# Altium schematic sheet 203_DC-DC.SchDoc: DC-DC
size A4; Date: XXXXXX; Author: R.Ducuara; DrawnBy: J.Jaramillo; Revision: R1V0; SheetNumber: 6; SheetTotal: 7
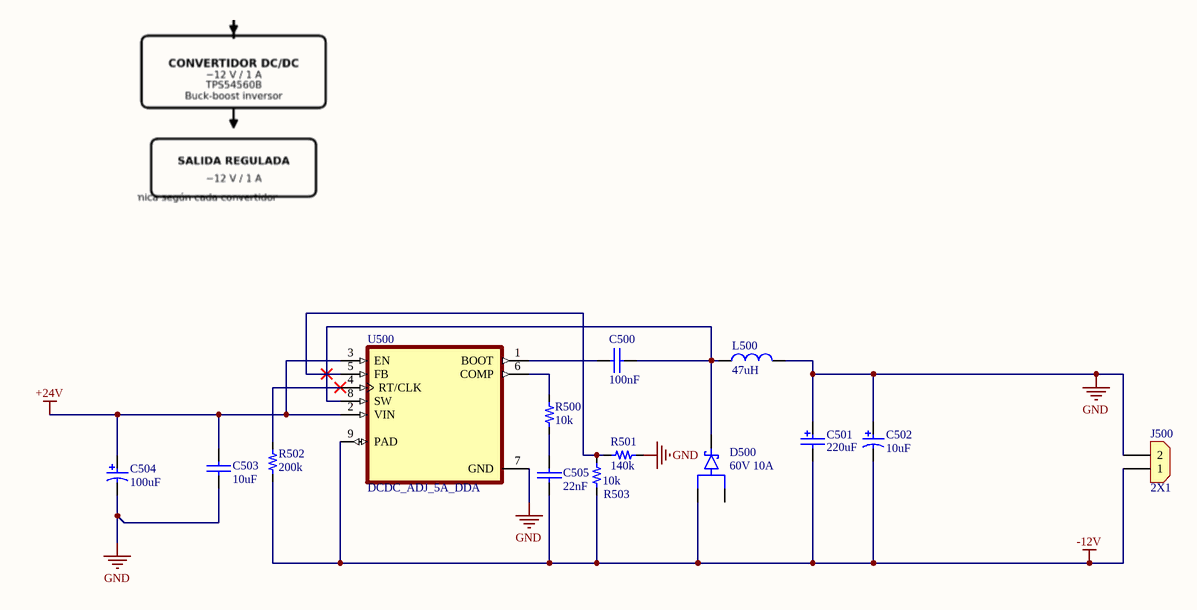
[diagram p0: 203_DC-DC.SchDoc]

## Parts
C500  value 100nF  [1206]  (hidden comment: 100nF 100V)
C501  value 220uF  [RADIAL-CAN-SMD_Diax8mm_Hx10.2mm]  (hidden comment: 220uF 35V)
C502  value 10uF  [RADIAL-CAN-SMD_Diax4mm_Hx5.5mm]  (hidden comment: 10uF 25V)
C503  value 10uF  [1206]  (hidden comment: 10uF 50V)
C504  value 100uF  [RADIAL-CAN-SMD_Diax8mm_Hx10.2mm]  (hidden comment: 100uF 25V)
C505  value 22nF  [0402_1.0mm]  (hidden comment: 22nF 25V)
D500  60V 10A  [D_Schottky_30V_200mA_SOT23-3_1]
J500  2X1  [CON_2X1_TH_5MM_BAT]
L500  value 47uH  [L_2SMD_11.5x10X4MM]  (hidden comment: 47uH 3A)
R500  value 10k  [0603]  (hidden comment: 10k 1/10W)
R501  value 140k  [0603]  (hidden comment: 140K 1/10W)
R502  value 200k  [1206]  (hidden comment: 200k 1/4W)
R503  value 10k  [0603]  (hidden comment: 10k 1/10W)
U500  DCDC_ADJ_5A_DDA  [DCDC_ADJ_5A_DDA]

## Nets
+24V: C503.1 C504.1 U500.2(VIN) U500.3(EN)
-12V: C501.2 C502.2 C505.2 D500.1(A1) J500.1 R502.1 R503.1 U500.9(PAD)
GND: C501.1 C502.1 C503.2 C504.2 J500.2 L500.2 R501.2 U500.7(GND)
NetC500_1: C500.1 U500.1(BOOT)
NetC500_2: C500.2 D500.3(K) L500.1 U500.8(SW)
NetC505_1: C505.1 R500.1
NetR500_2: R500.2 U500.6(COMP)
NetR501_1: R501.1 R503.2 U500.5(FB)
NetR502_2: R502.2 U500.4(RT/CLK)

Not connected (* = marked no-connect by the designer): D500 2(A2)

## Notes on the sheet
- Title:
- Project:
- File:
- Revision:
- Date:
- Size:
- A4
- Drawn by:

## Library data of the parts
C500 = Cap_0.1uF_1206_100V: CAP CER 0.1UF 100V X7R 1206; Manufacturer: Samsung Electro-Mechanics; Manufacturer Part Number: CL31B104KCFNNNE; Supplier 1: Digi-Key; Supplier Part Number 1: 1276-1151-1-ND; Last modified by: J.Jaramillo; Last modified date: 20240309; ComponentLink1Description: Digi-Key; ComponentLink1URL: https://www.digikey.com/en/products/detail/samsung-electro-mechanics/CL31B104KCFNNNE/3886809
C501 = Cap_220uF_35V_ALU_SMD_1: CAP ALUM 220UF 20% 35V SMD; Manufacturer: Panasonic Electronic Components; Manufacturer Part Number: EEE-1VA221UP; Supplier 1: Digi-Key; Supplier Part Number 1: PCE3955CT-ND; Reel stock: N/A; Last modified by: J.Jaramillo; Last modified date: 20240309; ComponentLink1Description: Digi-Key; ComponentLink1URL: https://www.digikey.com/products/en?keywords=PCE3955CT-ND
C502 = Cap_10uF_25V_ALU_SMD: CAP ALUM 10UF 20% 25V SMD; Manufacturer: Würth Elektronik; Manufacturer Part Number: 865080440002; Last modified by: J.Jaramillo; Last modified date: 20240309; ComponentLink1Description: Digi-Key; ComponentLink1URL: https://www.digikey.com/product-detail/en/w-rth-elektronik/865080440002/732-8430-1-ND/5728387; Supplier 1: Digi-Key; Supplier Part Number 1: 732-8430-1-ND
C503 = Cap_10uF_1206_50V: CAP CER 10UF 50V X5R 1206; Manufacturer: Murata Electronics North America; Manufacturer Part Number: GRT31CR61H106ME01L; Last modified by: J.Jaramillo; Last modified date: 20240309; ComponentLink1Description: Digi-Key; ComponentLink1URL: https://www.digikey.com/product-detail/en/murata-electronics-north-america/GRT31CR61H106ME01L/490-12457-1-ND/5417158; Supplier 1: Digi-Key; Supplier Part Number 1: 490-12457-1-ND
C504 = Cap_100uF_25V_ALU_SMD: CAP ALUM 100UF 20% 25V SMD; Manufacturer: Panasonic Electronic Components; Manufacturer Part Number: EEE-1EA101AP; Supplier 1: Digi-Key; Supplier Part Number 1: PCE4593CT-ND; Last modified by: J.Jaramillo; Last modified date: 20240309; ComponentLink1Description: Digi-Key; ComponentLink1URL: https://www.digikey.com/product-detail/en/panasonic-electronic-components/EEE-1EA101AP/PCE4593CT-ND/1718016
C505 = Cap_0.022uF_0402_25V: CAP CER 0.022UF 25V X7R 0402; Manufacturer: Murata Electronics North America; Manufacturer Part Number: GRM155R71E223KA61D; Supplier 1: Digi-Key; Supplier Part Number 1: 490-3252-1-ND; Last modified by: J.Jaramillo; Last modified date: 20240309; ComponentLink1Description: Digi-key; ComponentLink1URL: https://www.digikey.com/en/products/detail/murata-electronics/GRM155R71E223KA61D/702517?s=N4IgTCBcDaIOICUCyBGArGhB2FBRMYAzANICCAbCgCIgC6AvkA
D500 = D_Schottky_60V_10A_ThinDPAK: DIODE SCHOTTKY 60V 10A THINDPAK; Manufacturer: Taiwan Semiconductor Corporation; Manufacturer Part Number: MBRAD1060H; Supplier 1: Digi-Key; Supplier Part Number 1: 1801-MBRAD1060HCT-ND; Reel Stock: N/A; Last modified by: R.Ducuara; Last modified date: 20261120; ComponentLink1Description: Digi-Key; ComponentLink1URL: https://www.digikey.com/en/products/detail/onsemi/SBAT54SLT1G/3062594
J500 = Con_2x1_TH_5mm_Battery: Power Connectors ROHS; Manufacturer: Changzhou Amass Elec; Manufacturer Part Number: XT30U-M; Supplier 1: LCSC; Supplier Part Number 1: C99101; Reel Stock: N/A; Last modified by: J.Jaramillo; Last modified date: 20240310; ComponentLink1Description: Digi-Key; ComponentLink1URL: https://lcsc.com/product-detail/Power-Connectors_Changzhou-Amass-Elec-XT30U-M_C99101.html
L500 = L_47uH_3A_SMD_11.5x10MM: 3A 47uH 4,5A 155mÎ© Â±20% SMD,11,5x10mm Fixed Inductors RoHS; Manufacturer: Shun Xiang Nuo; Manufacturer Part Number: SMMS1040-470M; Supplier 1: LCSC; Supplier Part Number 1: C149599; Reel Stock: N/A; Last modified by: J.Jaramillo; Last modified date: 270326; ComponentLink1Description: Datasheet; ComponentLink1URL: https://www.lcsc.com/datasheet/C149599.pdf; ComponentLink2Description: LCSC; ComponentLink2URL: https://www.lcsc.com/product-detail/C149599.html
R500 R503 = Res_10k_0603_1/10W: RES SMD 10K OHM 1% 1/10W 0603; Manufacturer: Samsung Electro-Mechanics; Manufacturer Part Number: RC1608F103CS; ComponentLink1URL: https://www.digikey.com/products/en?keywords=1276-3485-1-ND; Supplier 1: Digi-Key; Supplier Part Number 1: 1276-3485-1-ND; Reel Stock: N/A; Last modified by: J.Jaramillo; Last modified date: 20240310; ComponentLink1Description: Digi-key
R501 = Res_140K_0603_1/10W_1%: RES SMD 140K OHM 1% 1/10W 0603; Manufacturer: Yageo; Manufacturer Part Number: RC0603FR-07140KL; Supplier 1: Digi-Key; Supplier Part Number 1: 311-140KHRCT-ND; Reel Stock: N/A; Last modified by: J.Jaramillo; Last modified date: 20240310; ComponentLink1Description: Digi-Key; ComponentLink1URL: https://www.digikey.com/en/products/detail/yageo/RC0603FR-07140KL/726947?s=N4IgTCBcDaIEoGEAMA2JBmAYnAtEg7AIwAsSA0gDIgC6AvkA
R502 = Res_200k_1206_1/4W: RES 200K OHM 1% 1/4W 1206; Manufacturer: Stackpole Electronics Inc; Manufacturer Part Number: RMCF1206FT200K; Supplier 1: Digi-Key; Supplier Part Number 1: RMCF1206FT200KTR-ND; Reel Stock: N/A; Last modified by: J.Jaramillo; Last modified date: 20240310; ComponentLink1Description: Digi-Key; ComponentLink1URL: https://www.digikey.com/product-detail/en/stackpole-electronics-inc/RMCF1206FT200K/RMCF1206FT200KTR-ND/1759778
U500 = DCDC_ADJ_5A_DDA: IC REG BCK SPLIT RAIL ADJ 8SOPWR; Manufacturer: Texas Instruments; Manufacturer Part Number: TPS54560BDDA; Supplier 1: Digikey; Supplier Part Number 1: 296-TPS54560BDDA-ND; Reel Stock: N/A; Last modified by: R.Ducuara; Last modified date: 20261120